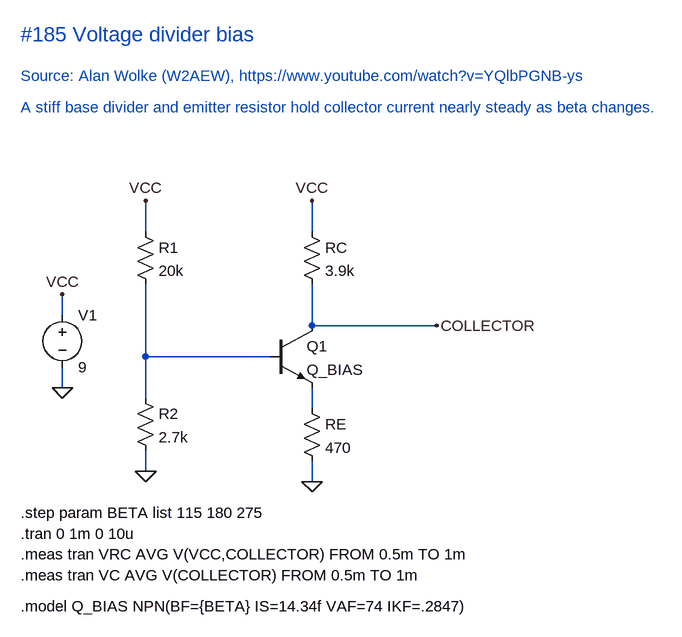
[diagram p0: schematic Voltage Divider Bias.asc]
Voltage Divider Bias.asc, the LTspice schematic file:
Version 4.1
SHEET 1 1112 980
WIRE 224 336 224 288
WIRE 480 336 480 288
WIRE 96 464 96 432
WIRE 480 480 480 416
WIRE 672 480 480 480
WIRE 224 528 224 416
WIRE 416 528 224 528
WIRE 96 576 96 544
WIRE 224 592 224 528
WIRE 480 608 480 576
WIRE 224 704 224 672
WIRE 480 720 480 688
FLAG 96 432 VCC
FLAG 96 576 0
FLAG 224 288 VCC
FLAG 224 704 0
FLAG 480 288 VCC
FLAG 480 720 0
FLAG 672 480 COLLECTOR
SYMBOL voltage 96 448 R0
WINDOW 123 0 0 Left 0
WINDOW 39 0 0 Left 0
SYMATTR InstName V1
SYMATTR Value 9
SYMBOL res 464 320 R0
SYMATTR InstName RC
SYMATTR Value 3.9k
SYMBOL npn 416 480 R0
SYMATTR InstName Q1
SYMATTR Value Q_BIAS
SYMBOL res 208 320 R0
SYMATTR InstName R1
SYMATTR Value 20k
SYMBOL res 208 576 R0
SYMATTR InstName R2
SYMATTR Value 2.7k
SYMBOL res 464 592 R0
SYMATTR InstName RE
SYMATTR Value 470
TEXT 32 32 Left 3 ;#185 Voltage divider bias
TEXT 32 96 Left 2 ;Source: Alan Wolke (W2AEW), https://www.youtube.com/watch?v=YQlbPGNB-ys
TEXT 32 144 Left 2 ;A stiff base divider and emitter resistor hold collector current nearly steady as beta changes.
TEXT 32 768 Left 2 !.step param BETA list 115 180 275
TEXT 32 800 Left 2 !.tran 0 1m 0 10u
TEXT 32 832 Left 2 !.meas tran VRC AVG V(VCC,COLLECTOR) FROM 0.5m TO 1m
TEXT 32 864 Left 2 !.meas tran VC AVG V(COLLECTOR) FROM 0.5m TO 1m
TEXT 32 912 Left 2 !.model Q_BIAS NPN(BF={BETA} IS=14.34f VAF=74 IKF=.2847)

The netlist it stands for:
* Voltage Divider Bias.asc
V1 VCC 0 9
RC VCC COLLECTOR 3.9k
Q1 COLLECTOR N001 N002 0 Q_BIAS
R1 VCC N001 20k
R2 N001 0 2.7k
RE N002 0 470
.model NPN NPN
.model PNP PNP
.lib standard.bjt
* #185 Voltage divider bias
* Source: Alan Wolke (W2AEW), https://www.youtube.com/watch?v=YQlbPGNB-ys
* A stiff base divider and emitter resistor hold collector current nearly steady as beta changes.
.step param BETA list 115 180 275
.tran 0 1m 0 10u
.meas tran VRC AVG V(VCC,COLLECTOR) FROM 0.5m TO 1m
.meas tran VC AVG V(COLLECTOR) FROM 0.5m TO 1m
.model Q_BIAS NPN(BF={BETA} IS=14.34f VAF=74 IKF=.2847)
.backanno
.end